# Altium schematic sheet tc264 母版供电v3.SchDoc
size A3
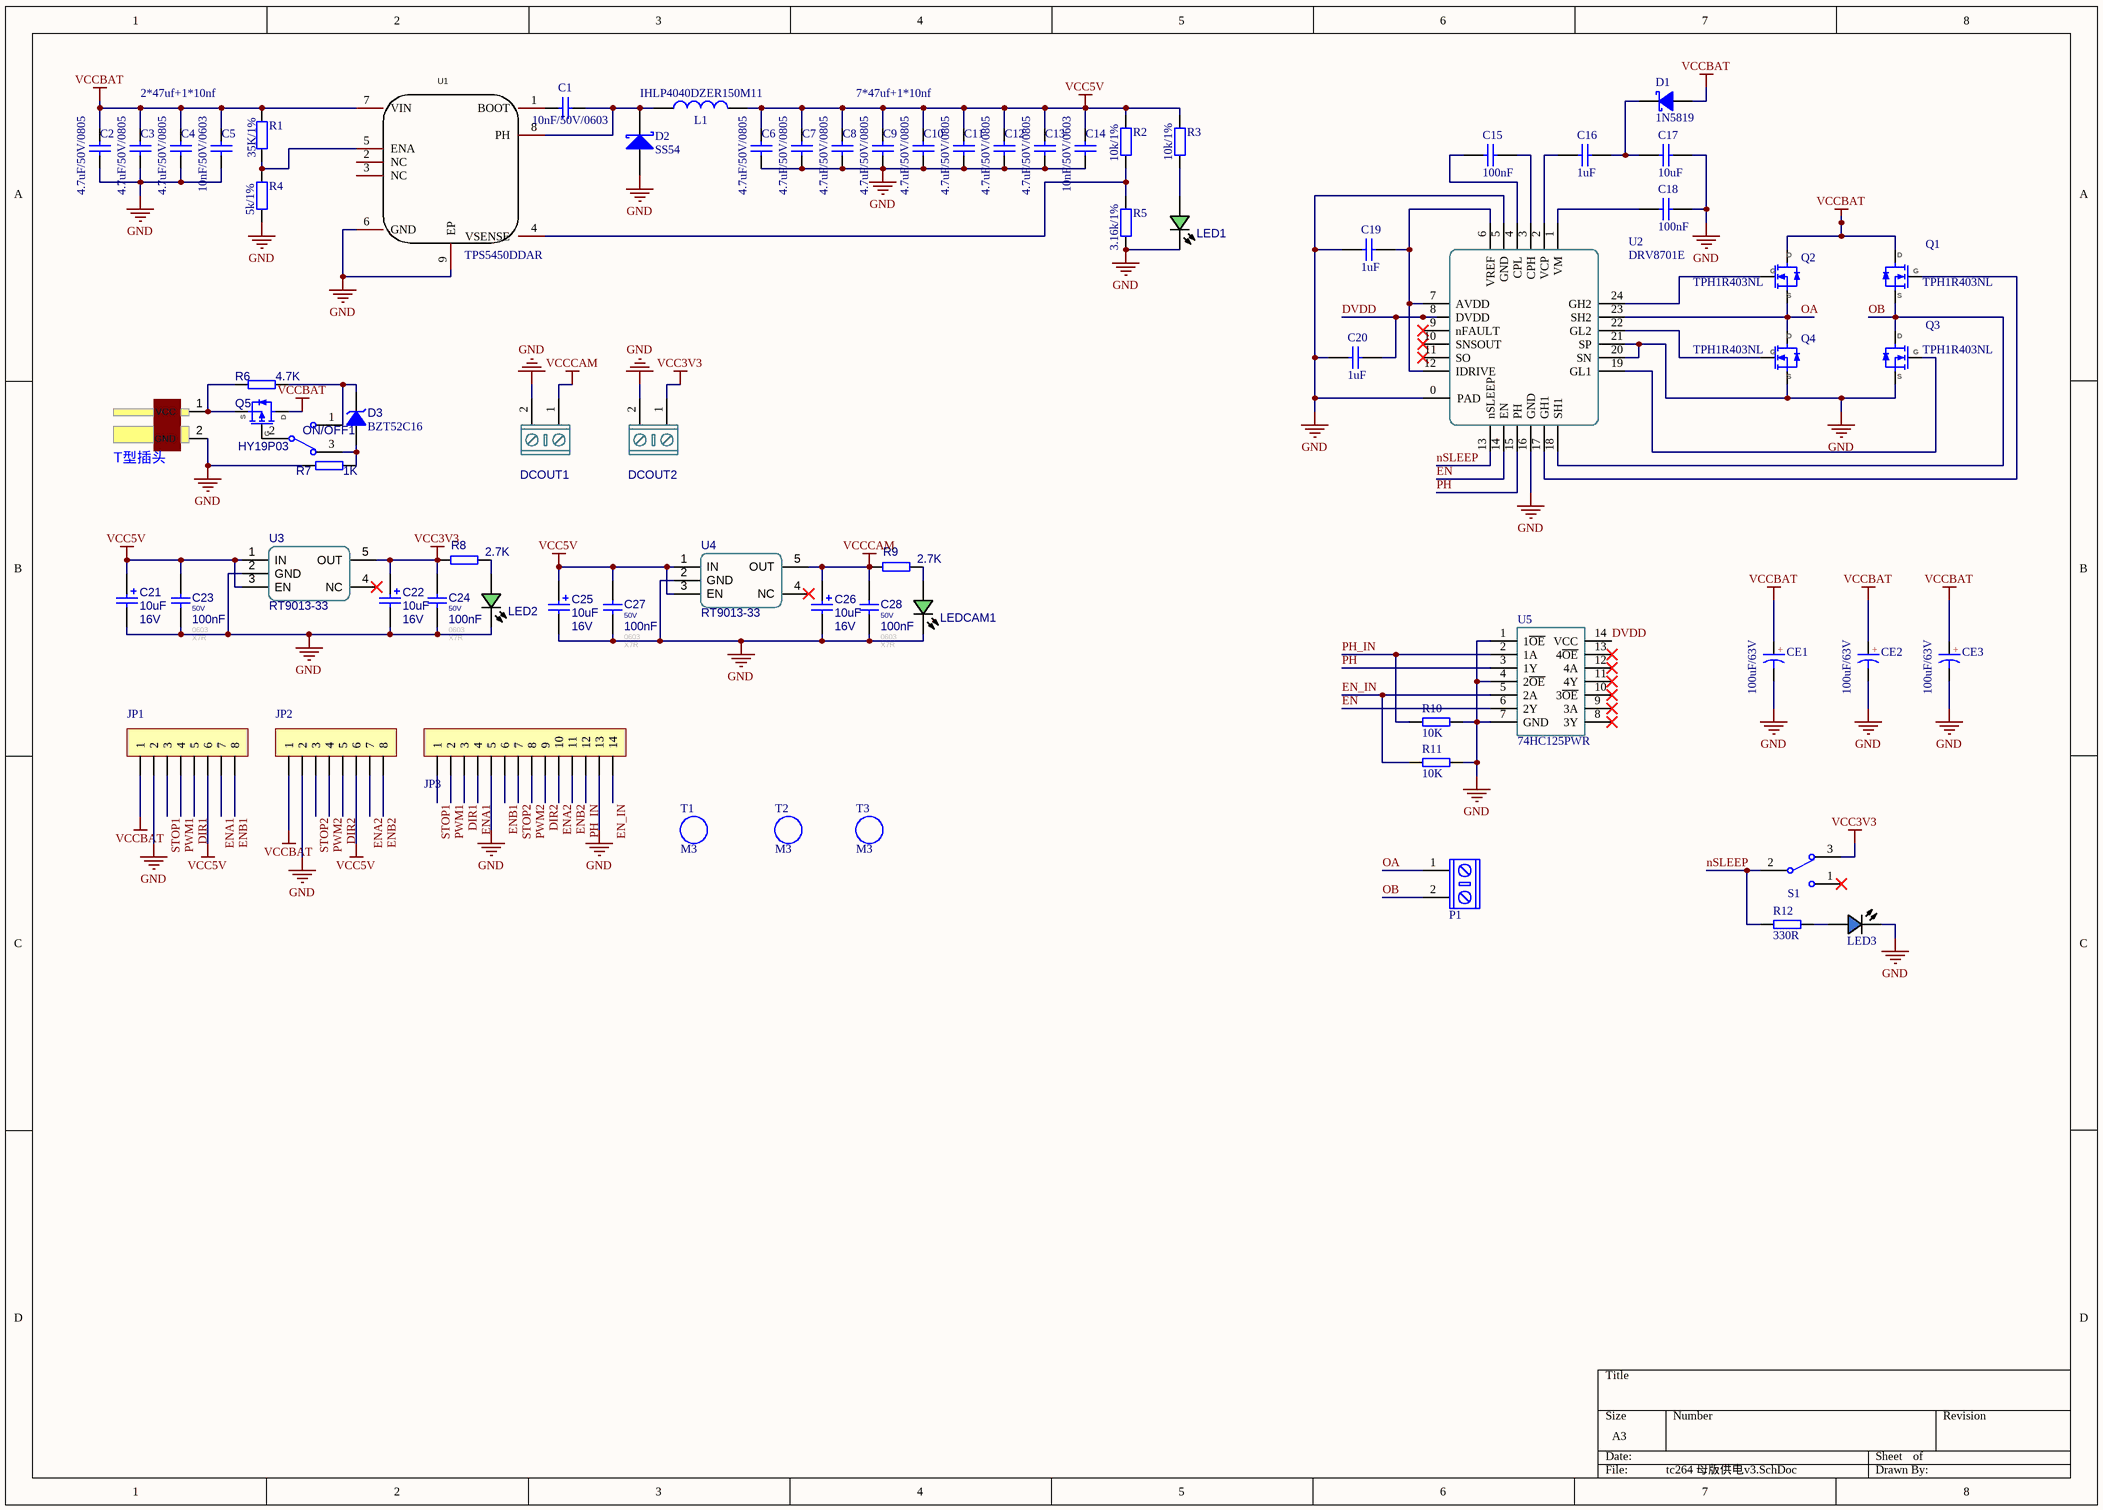
[diagram p0: tc264 母版供电v3.SchDoc]

## Parts
C1  10nF/50V/0603  [C0805_M]
C2  4.7uF/50V/0805  [C0805_M]
C3  4.7uF/50V/0805  [C0805_M]
C4  4.7uF/50V/0805  [C0805_M]
C5  10nF/50V/0603  [C0805_M]
C6  4.7uF/50V/0805  [C0805_M]
C7  4.7uF/50V/0805  [C0805_M]
C8  4.7uF/50V/0805  [C0805_M]
C9  4.7uF/50V/0805  [C0805_M]
C10  4.7uF/50V/0805  [C0805_M]
C11  4.7uF/50V/0805  [C0805_M]
C12  4.7uF/50V/0805  [C0805_M]
C13  4.7uF/50V/0805  [C0805_M]
C14  10nF/50V/0603  [C0805_M]
C15  value 100nF  [CAPC1608[0603]S-N]  (hidden comment: 100nF ±10% 50V)
C16  value 1uF  [CAPC1608[0603]S-N]  (hidden comment: 1uF ±10% 25V)
C17  value 10uF  [CAPC2012[0805]S-N]  (hidden comment: 10uF ±10% 25V)
C18  value 100nF  [CAPC1608[0603]S-N]  (hidden comment: 100nF ±10% 50V)
C19  value 1uF  [CAPC1608[0603]S-N]  (hidden comment: 1uF ±10% 25V)
C20  value 1uF  [CAPC1608[0603]S-N]  (hidden comment: 1uF ±10% 25V)
C21  value 10uF  Voltage: 16V  [CAPT3216]  (hidden comment: 10uF 16V)
C22  value 10uF  Voltage: 16V  [CAPT3216]  (hidden comment: 10uF 16V)
C23  value 100nF  Voltage: 50V  Footprint: 0603  Type: X7R  [CAPC1608[0603]S-N]  (hidden comment: 100nF ±10% 50V)
C24  value 100nF  Voltage: 50V  Footprint: 0603  Type: X7R  [CAPC1608[0603]S-N]  (hidden comment: 100nF ±10% 50V)
C25  value 10uF  Voltage: 16V  [CAPT3216]  (hidden comment: 10uF 16V)
C26  value 10uF  Voltage: 16V  [CAPT3216]  (hidden comment: 10uF 16V)
C27  value 100nF  Voltage: 50V  Footprint: 0603  Type: X7R  [CAPC1608[0603]S-N]  (hidden comment: 100nF ±10% 50V)
C28  value 100nF  Voltage: 50V  Footprint: 0603  Type: X7R  [CAPC1608[0603]S-N]  (hidden comment: 100nF ±10% 50V)
CE1  100uF/63V  [CE-3.5*8*11.5]
CE2  100uF/63V  [CE-3.5*8*11.5]
CE3  100uF/63V  [CE-3.5*8*11.5]
D1  1N5819  [SOD-123-L]
D2  SS54  [SMC]
D3  BZT52C16  [SOD-123-L]
DCIN1  T型插头  [Wired T-Header ThroughHole]
DCOUT1  KF/WJ/DG 30x connecter  [KF/WJ/DG 301-2p-5.0mm]  (value not drawn)
DCOUT2  KF/WJ/DG 30x connecter  [KF/WJ/DG 301-2p-5.0mm]  (value not drawn)
JP1  HDR-1X8  [ZH1.5-WI-8P]  (value not drawn)
JP2  HDR-1X8  [ZH1.5-WI-8P]  (value not drawn)
JP3  HDR-1X14  [XH2.54-LI-14P]  (value not drawn)
L1  IHLP4040DZER150M11  [L-SMD-0630]
LED1  翠绿贴片LED  [LEDC1608(0603)]  (value not drawn)
LED2  翠绿贴片LED  [LEDC1608(0603)]  (value not drawn)
LED3  Blue  [LEDC1608(0603)]  (value not drawn)
LEDCAM1  翠绿贴片LED  [LEDC1608(0603)]  (value not drawn)
ON/OFF1  SW-SPDT  [SS12D10]  (value not drawn)
P1  KF/WJ/DG 30x connecter  [KF/WJ/DG 301-2p-5.0mm]  (value not drawn)
Q1  TPH1R403NL  [DFN5x6]
Q2  TPH1R403NL  [DFN5x6]
Q3  TPH1R403NL  [DFN5x6]
Q4  TPH1R403NL  [DFN5x6]
Q5  HY19P03  [TO-252AA]
R1  35K/1%  [R0805_L]
R2  10k/1%  [R0805_L]
R3  10k/1%  [R0805_L]
R4  5k/1%  [R0805_L]
R5  3.16k/1%  [R0805_L]
R6  value 4.7K  [RESC1608[0603]S-N]  (hidden comment: 4.7K ±1%)
R7  value 1K  [RESC1608[0603]S-N]  (hidden comment: 1K ±1%)
R8  value 2.7K  [RESC1608[0603]S-N]  (hidden comment: 2.7K ±1%)
R9  value 2.7K  [RESC1608[0603]S-N]  (hidden comment: 2.7K ±1%)
R10  value 10K  [RESC1608[0603]S-N]  (hidden comment: 10K ±1%)
R11  value 10K  [RESC1608[0603]S-N]  (hidden comment: 10K ±1%)
R12  value 330R  [RESC1608[0603]S-N]  (hidden comment: 330R ±1%)
S1  SW-SPDT  [SS12D10]  (value not drawn)
T1  M3  [M3 125X200]
T2  M3  [M3 125X200]
T3  M3  [M3 125X200]
U1  TPS5450DDAR  [SOP-8_L4.9-W3.9-P1.27-LS6.0-BL-EP]
U2  DRV8701E  [QFN24-4x4]
U3  RT9013-33  [SOT-23-5]
U4  RT9013-33  [SOT-23-5]
U5  74HC125PWR  [TSSOP-14]

## Nets
GND: C2.1 C3.1 C4.1 C5.1 C6.1 C7.1 C8.1 C9.1 C10.1 C11.1 C12.1 C13.1 C14.1 C17.2 C18.2 C19.1 C20.1 C21.2 C22.2 C23.2 C24.2 C25.2 C26.2 C27.2 C28.2 CE1.2 CE2.2 CE3.2 D2.1(A) DCIN1.2(GND) DCOUT1.2 DCOUT2.2 JP1.2 JP2.2 JP3.5 JP3.13 LED1.C LED2.C LED3.C LEDCAM1.C Q3.3(S) Q4.3(S) R4.1 R5.1 R7.1 R10.2 R11.2 U1.6(GND) U1.9(EP) U2.0(PAD) U2.5(GND) U2.16(GND) U2.20(SN) U2.21(SP) U3.2(GND) U4.2(GND) U5.1(1~{OE}) U5.4(2~{OE}) U5.7(GND)
VCC3V3: C22.1 C24.1 DCOUT2.1 R8.1 S1.3 U3.5(OUT)
VCC5V: C6.2 C7.2 C8.2 C9.2 C10.2 C11.2 C12.2 C13.2 C14.2 C21.1 C23.1 C25.1 C27.1 JP1.6 JP2.6 L1.2 R2.2 R3.2 U3.1(IN) U3.3(EN) U4.1(IN) U4.3(EN)
VCCBAT: C2.2 C3.2 C4.2 C5.2 CE1.1 CE2.1 CE3.1 D1.A JP1.1 JP2.1 Q1.1(D) Q2.1(D) Q5.1(D) R1.2 U1.7(VIN)
VCCCAM: C26.1 C28.1 DCOUT1.1 R9.1 U4.5(OUT)
DIR1: JP1.5 JP3.3
DIR2: JP2.5 JP3.9
DVDD: C20.2 U2.8(DVDD) U5.14(VCC)
EN: U2.14(EN) U5.6(2Y)
EN_IN: JP3.14 R11.1 U5.5(2A)
ENA1: JP1.7 JP3.4
ENA2: JP2.7 JP3.10
ENB1: JP1.8 JP3.6
ENB2: JP2.8 JP3.11
nSLEEP: R12.1 S1.2 U2.13(nSLEEP)
OA: P1.1 Q2.3(S) Q4.1(D) U2.23(SH2)
OB: P1.2 Q1.3(S) Q3.1(D) U2.18(SH1)
PH: U2.15(PH) U5.3(1Y)
PH_IN: JP3.12 R10.1 U5.2(1A)
PWM1: JP1.4 JP3.2
PWM2: JP2.4 JP3.8
STOP1: JP1.3 JP3.1
STOP2: JP2.3 JP3.7
NetC1_1: C1.1 D2.2(K) L1.1 U1.8(PH)
NetC1_2: C1.2 U1.1(BOOT)
NetC15_1: C15.1 U2.4(CPL)
NetC15_2: C15.2 U2.3(CPH)
NetC16_1: C16.1 U2.2(VCP)
NetC16_2: C16.2 C17.1 D1.K
NetC18_1: C18.1 U2.1(VM)
NetC19_2: C19.2 U2.6(VREF) U2.7(AVDD) U2.12(IDRIVE)
NetD3_A: D3.A ON/OFF1.3 R7.2
NetD3_K: D3.K ON/OFF1.1 R6.2
NetDCIN1_1: DCIN1.1(VCC) Q5.3(S) R6.1
NetLED1_A: LED1.A R3.1
NetLED2_A: LED2.A R8.2
NetLED3_A: LED3.A R12.2
NetLEDCAM1_A: LEDCAM1.A R9.2
NetON/OFF1_2: ON/OFF1.2 Q5.2(G)
NetQ1_2: Q1.2(G) U2.17(GH1)
NetQ2_2: Q2.2(G) U2.24(GH2)
NetQ3_2: Q3.2(G) U2.19(GL1)
NetQ4_2: Q4.2(G) U2.22(GL2)
NetR1_1: R1.1 R4.2 U1.5(ENA)
NetR2_1: R2.1 R5.2 U1.4(VSENSE)

Not connected (* = marked no-connect by the designer): S1 1*; U1 2(NC) 3(NC); U2 9(nFAULT)* 10(SNSOUT)* 11(SO)*; U3 4(NC)*; U4 4(NC)*; U5 8(3Y)* 9(3A)* 10(3~{OE})* 11(4Y)* 12(4A)* 13(4~{OE})*

## Notes on the sheet
- 2*47uf+1*10nf
- 7*47uf+1*10nf
- (in symbol CE) +

## Library data of the parts
C1-C14 = C: 贴片电容/MLCC电容; BOM名称: 无极性贴片电容; 联系下单店铺卖家 免费帮你查找封装: 联系下单店铺卖家 免费技术支持
C15 C18 = Cap-Chip_1: 贴片电容; Published: 8-Jun-2000; Revision: July-2002: Re-released for DXP Platform.; Publisher: Altium Limited; Price(RMB): 0.000; Voltage: 50V; Tolerance: ±10%
C16 C19 C20 = Cap-Chip_2: 贴片电容; Published: 8-Jun-2000; Revision: July-2002: Re-released for DXP Platform.; Publisher: Altium Limited; Price(RMB): 0.000; Voltage: 25V; Tolerance: ±10%
C17 C23 C24 C27 C28 = Cap-Chip: 贴片电容; Tolerance: ±10%
  C17: Published: 8-Jun-2000; Revision: July-2002: Re-released for DXP Platform.; Publisher: Altium Limited; Price(RMB): 0.000; Voltage: 25V
  C23 C24 C27 C28: Published: 2021-12-13; Revision: V1.2
C21 C22 C25 C26 = Cap-Tan: Tantalum Capacitor; Published: 8-Jun-2000; Revision: July-2002: Re-released for DXP Platform.; Publisher: Altium Limited; Price(RMB): 0.000
CE1-CE3 = CE: 直插电解电容; 联系下单店铺卖家 免费帮你查找封装: 联系下单店铺卖家 免费技术支持; BOM名称: 直插电解电容
D1 = Diode Schottky: 肖特基二极管 Diode; Imax: 500mA; Published: 8-Jun-2000; Revision: July-2002: Re-released for DXP Platform.; Publisher: Altium Limited; Price(RMB): 0.000; PartNumber: 1N5819
D2 = SS54: 肖特基二极管; 属性: 40V/5A; 以赠品形式获赠本封装库的买家，还可联系卖家免费指导AD软件使用: 封装库来自淘宝卖家ID：黄晶宝石; BOM名称: 肖特基二极管
D3 = Diode TVS Uni-Dir: TRANSIENT VOLTAGE  SUPPRESSOR DIODE; Imax: 500mA; Published: 8-Jun-2000; Publisher: Altium Limited; Price(RMB): 0.000
DCIN1 = T_Header
DCOUT1 DCOUT2 P1 = KF/WJ/DG 30x: 接线端子 2Pin
JP1 JP2 = Header 8: 8P接插件; 联系卖家，免费查找封装: 唯一出售店铺网址https://shop463601444.taobao.com; BOM名称: 8P接插件
JP3 = Header 14: 14P接插件; 联系卖家，免费查找封装: 唯一出售店铺网址https://shop463601444.taobao.com; 封装库来自淘宝卖家ID：黄晶宝石: 其他店铺购入均为盗版封装库，请立即申请退款，本店现金奖励50~200元; BOM名称: 14P接插件
L1 = L: 贴片小功率电感; BOM名称: 小功率贴片电感; 联系下单店铺卖家 免费帮你查找封装: 联系下单店铺卖家 免费技术支持
LED1 LED2 LEDCAM1 = LED Chip Green: Published: 8-Jun-2000; Revision: July-2002: Re-released for DXP Platform.; Publisher: Altium Limited; Price(RMB): 0.00
LED3 = LED Chip Blue: Typical Chip LED; Published: 8-Jun-2000; Revision: July-2002: Re-released for DXP Platform.; Publisher: Altium Limited; Price(RMB): 0.00; Color: Blue
ON/OFF1 S1 = SW-SPDT: 单刀双掷开关 3脚船型、钮子、拨动开关 SPDT Subminiature Toggle Switch; Published: 24-Mar-1999; Publisher: Altium Limited; Price(RMB): 0.000
Q1-Q4 = TPH1R403NL: 东芝 N沟 MOS
Q5 = HY19P03: HY19P03 P-Channel MOSFET
R1-R5 = R: 贴片电阻; 联系下单店铺卖家 免费帮你查找封装: 联系下单店铺卖家 免费技术支持; BOM名称: 贴片电阻
R6 = Res-Chip_4: 贴片电阻; Published: 8-Jun-2000; Revision: July-2002: Re-released for DXP Platform.; Tolerance: ±1%
R7 R12 = Res-Chip_3: 贴片电阻; Published: 8-Jun-2000; Revision: July-2002: Re-released for DXP Platform.; Tolerance: ±1%
  R12: Publisher: Altium Limited; Price(RMB): 0.000
R8 R9 = Res-Chip_2: 贴片电阻; Published: 8-Jun-2000; Revision: July-2002: Re-released for DXP Platform.; Tolerance: ±1%
R10 R11 = Res-Chip_1: 贴片电阻; Published: 8-Jun-2000; Revision: July-2002: Re-released for DXP Platform.; Publisher: Altium Limited; Price(RMB): 0.000; Tolerance: ±1%
T1-T3 = M3: 铜柱孔; 联系卖家，免费查找封装: 唯一出售店铺网址https://shop463601444.taobao.com; 封装库来自淘宝卖家：黄晶宝石: 其他店铺购入均为盗版封装库，请立即申请退款，本店现金奖励200~1000元; BOM名称: 铜柱孔
U1 = TPS5450DDAR: Manufacturer: TI(德州仪器); Add into BOM: yes; Function: 降压型; Name: TPS5450DDAR; Symbol: TPS5450DDAR; Device: TPS5450DDAR; LCSC Part Name: TPS5450DDAR; Supplier Part: C114425; Manufacturer Part: TPS5450DDAR; Supplier Footprint: SOP-8_EP_150mil; JLCPCB Part Class: Extended Part; Datasheet: https://atta.szlcsc.com/upload/public/pdf/source/20170620/1497944765773.pdf; Supplier: LCSC; Convert to PCB: yes; Synchronous Rectification: -; Number of Outputs: -; Topology: -; Input Voltage: -; Switching Frequency: -; Output Current (Max): -
U2 = DRV8701E: DRV8701E Ti全桥驱动芯片
U3 U4 = RT9013-33: 3.3V 500mA SOT-23-5 LDO
U5 = SN74HC125PWR: 三态输出的四路缓冲器 TSSOP-20